# Altium schematic sheet Coil_Gun_Master.SchDoc
size 199 x 149 mm; SheetNumber: 1; SheetTotal: 3
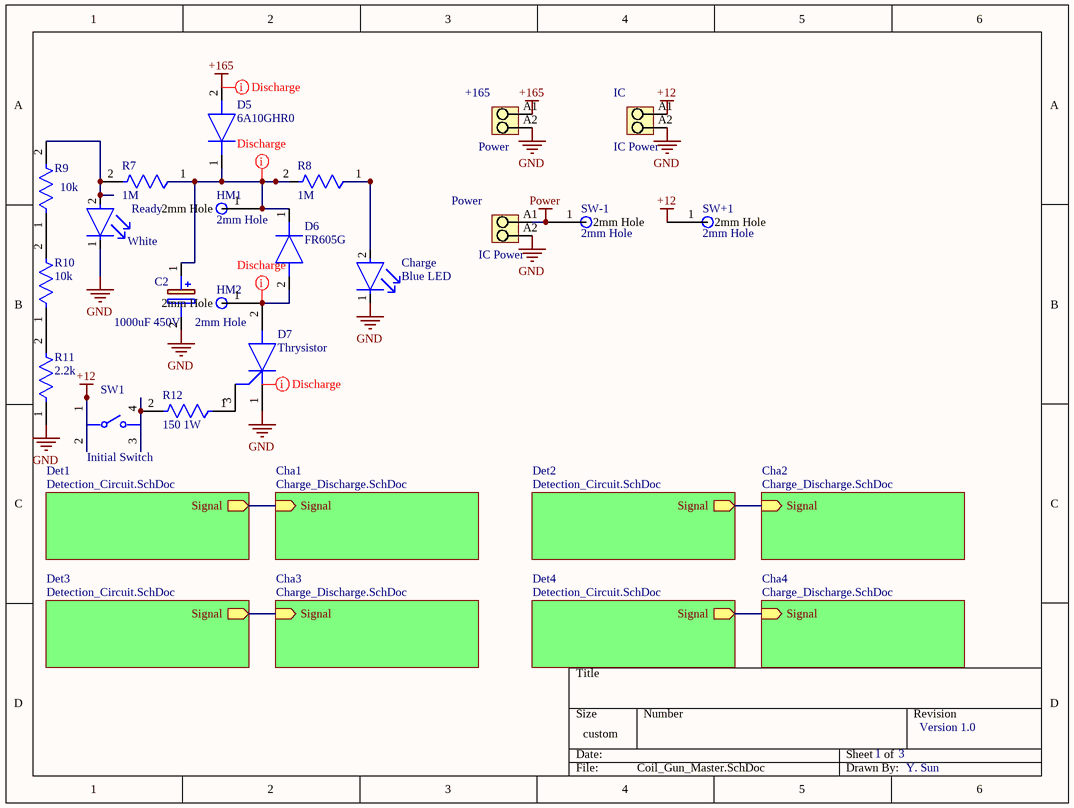
[diagram p0: Coil_Gun_Master.SchDoc]

## Parts
+165  Power  [PM_5_08_90_02]
C2  1000uF 450V  [CAPPRD1000W180D3550H6250]
Charge  Blue LED  [FP-XLUR12D-MFG]
D5  6A10GHR0  [DIOAD3685W130L885D700]
D6  FR605G  [DIOAD3685W130L885D700]
D7  Thrysistor  [FP-VS-70TPS12PBF-0]
HM1  2mm Hole  [2mmHole]
HM2  2mm Hole  [2mmHole]
IC  IC Power  [PM_5_08_90_02]
Power  IC Power  [PM_5_08_90_02]
R7  1M  [FP-CFR16-MFG]
R8  1M  [FP-CFR16-MFG]
R9  10k  [FP-CFR16-MFG]
R10  10k  [FP-CFR16-MFG]
R11  2.2k  [FP-CFR16-MFG]
R12  150 1W  [FP-RR01-MFG]
Ready  White  [FP-XLUR12D-MFG]
SW1  Initial Switch  [FP-1241_1625_8-MFG]
SW+1  2mm Hole  [2mmHole]
SW-1  2mm Hole  [2mmHole]

## Sub-sheets
Cha1 = Charge_Discharge.SchDoc: Signal (in)
Cha2 = Charge_Discharge.SchDoc: Signal (in)
Cha3 = Charge_Discharge.SchDoc: Signal (in)
Cha4 = Charge_Discharge.SchDoc: Signal (in)
Det1 = Detection_Circuit.SchDoc: Signal (out)
Det2 = Detection_Circuit.SchDoc: Signal (out)
Det3 = Detection_Circuit.SchDoc: Signal (out)
Det4 = Detection_Circuit.SchDoc: Signal (out)

## Nets
+12: IC.A1 SW1.1 SW1.2 SW+1.1(2mm_Hole)
+165: +165.A1 D5.2(A)
GND: +165.A2 C2.2(-) Charge.1(C) D7.1(K) IC.A2 Power.A2 R11.1 Ready.1(C)
Power: Power.A1 SW-1.1(2mm_Hole)
NetC2_1: C2.1(+) D5.1(K) D6.1(K) HM1.1(2mm_Hole) R7.1 R8.2
NetCharge_2: Charge.2(A) R8.1
NetD6_2: D6.2(A) D7.2(A) HM2.1(2mm_Hole)
NetD7_3: D7.3(G) R12.1
NetR7_2: R7.2 R9.2 Ready.2(A)
NetR9_1: R9.1 R10.2
NetR10_1: R10.1 R11.2
NetR12_2: R12.2 SW1.3 SW1.4
(unnamed): sheet Cha1/Signal, sheet Det1/Signal
(unnamed): sheet Cha2/Signal, sheet Det2/Signal
(unnamed): sheet Cha3/Signal, sheet Det3/Signal
(unnamed): sheet Cha4/Signal, sheet Det4/Signal

## Layout directives
net class Discharge: (no net found under the mark), +165, NetC2_1, NetD6_2

## Notes on the sheet
- 1
- 3
- Version 1.0
- Y. Sun

## Library data of the parts
+165 IC Power = CMP-1559-01627-1: OMNIMATE Signal - series PM; Manufacturer: Weidmueller; PartNumber: 1760490000; Contact_surface: tinned; Pitch_mm: 5,08 mm; Solid_min_H05_07_V_U: 0,13 mm²; Wire_cross_section_AWG_min_UL_1059: AWG 26; Wire_cross_section_AWG_max_UL_1059: AWG 14; Rated_voltage_for_surge_voltage_class_pollution_degree_II_2: 600 V; Rated_current_use_group_B_UL_1059: 15 A; Mounting_onto_the_PCB: Solder connection; Solder_pin_length_mm: 3,5 mm; Side_termination_characteristic: closed side; Contact_material: Cu-Leg; Pitch_inch: 0,2 inch; No_of_poles: 2; UL_94_flammability_rating: V-0; Insulating_material: Wemid (PA); Rated_voltage_use_group_B_UL_1059: 300 V; Solid_max_H05_07_V_U: 2,5 mm²; Short_text_for_material: PM 5.08/02/90 3.5SN OR BX; Revision: V1; Qty: 500 PCS; ComponentLink2Description: URL Link1; Packaging: Box; PackageReference: PM_5_08_90_02; ComponentLink2URL: http://catalog.weidmueller.com/catalog/Start.do?localeId=en&ObjectID=1760490000; Colour: Orange; ComponentLink1Description: Manufacturer URL; ComponentLink1URL: http://www.weidmueller.com/
C2 = EKHS451VSN102MA60S: Capacitor Polarised; Manufacturer_Name: Chemi-Con; Datasheet Link: https://www.mouser.cn/datasheet/2/420/United-Chemi-Con-1708643.pdf; Height: 62.5mm; Manufacturer_Part_Number: EKHS451VSN102MA60S
Charge Ready = CMP-02085-08376351-1: 627nm Red LED; 5x8.6mm, Through-Hole Mount with Red Diffused Round Lamp; Test Current: 10mA; Viewing Angle: 30°; Dominant Wavelength: 617nm; Luminous Intensity: 39mcd; Forward Voltage: 1.9V; Wavelength: 627nm; Case/Package: Radial; Lens Color: Red; Mount: Through Hole; Height: 8.6mm; Color: Red; Lifecycle Status: Production; Lens Transparency: Diffused; RoHS: Compliant
D5 D6 = 6A10GHR0: Diode; Manufacturer_Name: Taiwan Semiconductor; Datasheet Link: https://www.mouser.ca/ProductDetail/Taiwan-Semiconductor/6A10GHR0/?qs=iDAqbRYIEyDCJDGbzj9j3Q%3D%3D; Manufacturer_Part_Number: 6A10GHR0; Mouser Part Number: 821-6A10GHR0; Mouser Price/Stock: https://www.mouser.co.uk/ProductDetail/Taiwan-Semiconductor/6A10GHR0/?qs=iDAqbRYIEyDCJDGbzj9j3Q%3D%3D
D7 = CMP-02544-000003-1: SCR 1.2KV 75A SUPER-247; Hold Current: 200mA; Forward Voltage: 1.4V; Current Rating: 70A; RoHS Compliant: Yes; Min Operating Temperature: -40°C; Mount: Through Hole; Weight: 0.211644oz; Radiation Hardening: No; Series: -; Max Operating Temperature: 125°C; Packaging: Bulk; Package Quantity: 500; Length: 16.1mm; Max Repetitive Reverse Voltage (Vrrm): 1.2kV; Width: 5.5mm; RMS Current (Irms): 75A; Height: 20.8mm; Case/Package: TO-247; Number of Pins: 247; Contact Plating: Tin
HM1 HM2 SW+1 SW-1 = Hole2
R7-R11 = CMP-03212-000007-1: RES 120 OHM 1/4W 5% AXIAL; Resistance: 120R; Power Rating: 250mW; Number of Resistors: 1; Voltage Rating: 200V; Temperature Coefficient: 0ppm/°C; RoHS Compliant: Yes; Mount: Axial; Package Quantity: 5000; Diameter: 1.85mm; Number of Terminations: 2; Packaging: Cut Tape; Max Operating Temperature: 155°C; Resistance Tolerance: 5%; Termination: Axial; Length: 3.5mm; Max Power Dissipation: 250mW; Min Operating Temperature: -55°C; Resistor Type: Thin Film; Technology: CARBON FILM; Case/Package: Axial; Tolerance: 5%; Series: CFR16, Neohm; Voltage Rating (DC): 200V; ELV: Compliant; REACH SVHC: No SVHC
R12 = CMP-03212-000006-1: RES 100 OHM 5% 1W AXIAL; Temperature Coefficient: 300ppm/°C; Number of Resistors: 1; Resistance: 100R; Voltage Rating: 350V; Resistor Type: Power resistor; Mount: Axial; Power Rating: 1W; RoHS Compliant: Yes; Tolerance: 5%; Packaging: Ammo Pack; ELV: Compliant; Number of Terminations: 2; Case/Package: Axial
SW1 = CMP-26316-000004-1: SWITCH TACTILE SPST-NO 0.05A 42V; Illumination Type: Non-Illuminated; Mechanical Life: 1000000Cycles; Actuator Material: Polyphenylene; Switch Function: Off-Mom; Voltage Rating (AC): 30V; Actuator Type: Standard; Max Current Rating: 50mA; Ratings: IP67; Throw Configuration: SPST; Switch Travel: 0.35mm; Operating Force: 220gf; Max Operating Temperature: 85°C; Packaging: Bulk; Radiation Hardening: No; Max Voltage Rating (DC): 42V; Voltage Rating (DC): 42V; Termination: PC Pin; Min Operating Temperature: -40°C; Max Voltage Rating (AC): 30V; Mount: Through Hole; Weight: 0.003527oz; Current Rating: 50mA; RoHS Compliant: Yes; Series: PMS; Package Quantity: 100